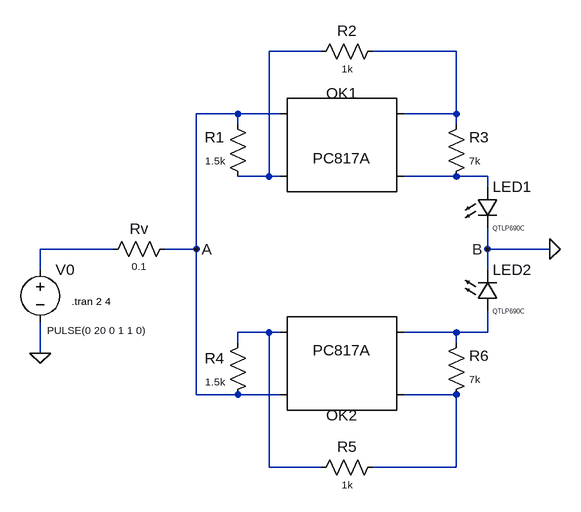
[diagram p0: schematic 09_RS_R1-1.5k_R4-1.5k_Rv-0.1.asc]
09_RS_R1-1.5k_R4-1.5k_Rv-0.1.asc, the LTspice schematic file:
Version 4
SHEET 1 880 680
WIRE 144 0 64 0
WIRE 352 0 224 0
WIRE 16 96 -48 96
WIRE 80 96 16 96
WIRE 352 96 352 0
WIRE 352 96 272 96
WIRE 16 112 16 96
WIRE 352 112 352 96
WIRE 64 192 64 0
WIRE 64 192 16 192
WIRE 80 192 64 192
WIRE 352 192 272 192
WIRE 400 192 352 192
WIRE 400 208 400 192
WIRE -176 304 -288 304
WIRE -48 304 -48 96
WIRE -48 304 -96 304
WIRE 400 304 400 272
WIRE 496 304 400 304
WIRE -288 336 -288 304
WIRE 400 336 400 304
WIRE 64 432 16 432
WIRE 80 432 64 432
WIRE 352 432 272 432
WIRE 400 432 400 400
WIRE 400 432 352 432
WIRE 16 448 16 432
WIRE 352 448 352 432
WIRE -288 464 -288 416
WIRE -48 528 -48 304
WIRE 16 528 -48 528
WIRE 80 528 16 528
WIRE 352 528 272 528
WIRE 64 640 64 432
WIRE 144 640 64 640
WIRE 352 640 352 528
WIRE 352 640 224 640
FLAG 496 304 0
FLAG -288 464 0
FLAG -48 304 A
FLAG 400 304 B
SYMBOL res 240 -16 R90
WINDOW 0 0 56 VBottom 2
WINDOW 3 32 56 VTop 1
SYMATTR InstName R2
SYMATTR Value 1k
SYMBOL res 32 208 R180
WINDOW 0 36 76 Left 2
WINDOW 3 36 40 Left 1
SYMATTR InstName R1
SYMATTR Value 1.5k
SYMBOL res 336 208 M180
WINDOW 0 36 76 Left 2
WINDOW 3 36 40 Left 1
SYMATTR InstName R3
SYMATTR Value 7k
SYMBOL PC817A 176 144 R0
WINDOW 0 0 -80 Center 2
SYMATTR InstName OK1
SYMBOL res 32 432 M0
WINDOW 0 36 40 Left 2
WINDOW 3 36 76 Left 1
SYMATTR InstName R4
SYMATTR Value 1.5k
SYMBOL res 240 624 R90
WINDOW 0 0 56 VBottom 2
WINDOW 3 32 56 VTop 1
SYMATTR InstName R5
SYMATTR Value 1k
SYMBOL voltage -288 320 R0
WINDOW 123 0 0 Left 2
WINDOW 39 0 0 Left 2
WINDOW 3 11 109 Left 1
SYMATTR Value PULSE(0 20 0 1 1 0)
SYMATTR InstName V0
SYMBOL PC817A 176 480 M180
WINDOW 0 0 -80 Center 2
SYMATTR InstName OK2
SYMBOL res -80 288 R90
WINDOW 0 0 56 VBottom 2
WINDOW 3 32 56 VTop 1
SYMATTR InstName Rv
SYMATTR Value 0.1
SYMBOL LED 384 208 R0
WINDOW 3 24 64 Left 0
SYMATTR Value QTLP690C
SYMATTR InstName LED1
SYMBOL LED 384 400 M180
WINDOW 0 24 64 Left 2
WINDOW 3 24 0 Left 0
SYMATTR InstName LED2
SYMATTR Value QTLP690C
SYMBOL res 336 544 M180
WINDOW 0 36 76 Left 2
WINDOW 3 36 40 Left 1
SYMATTR InstName R6
SYMATTR Value 7k
TEXT -240 384 Left 1 !.tran 2 4

The netlist it stands for:
* 09_RS_R1-1.5k_R4-1.5k_Rv-0.1.asc
R2 N002 N001 1k
R1 N001 A 1.5k
R3 N003 N002 7k
XOK1 A N001 N002 N003 PC817 Igain=1m
R4 N005 A 1.5k
R5 N007 N005 1k
V0 N004 0 PULSE(0 20 0 1 1 0)
XOK2 A N005 N007 N006 PC817 Igain=1m
Rv A N004 0.1
D§LED1 N003 0 QTLP690C
D§LED2 N006 0 QTLP690C
R6 N007 N006 7k
.model D D
.lib standard.dio
.tran 2 4
.lib PC817.sub
.backanno
.end